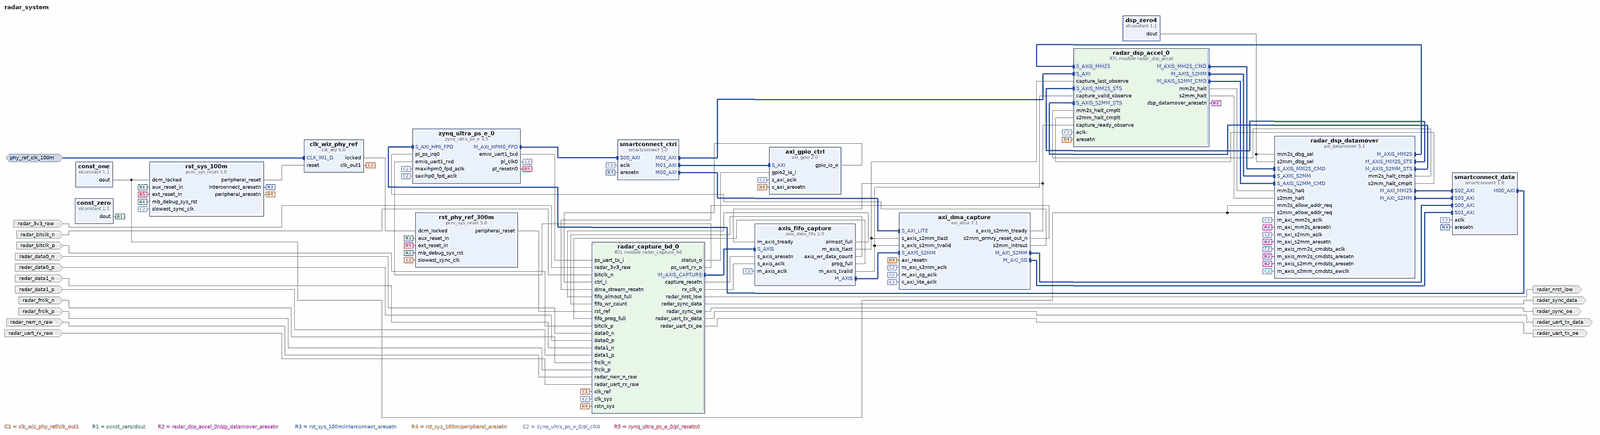
[diagram p0: block diagram of the top level, whole]
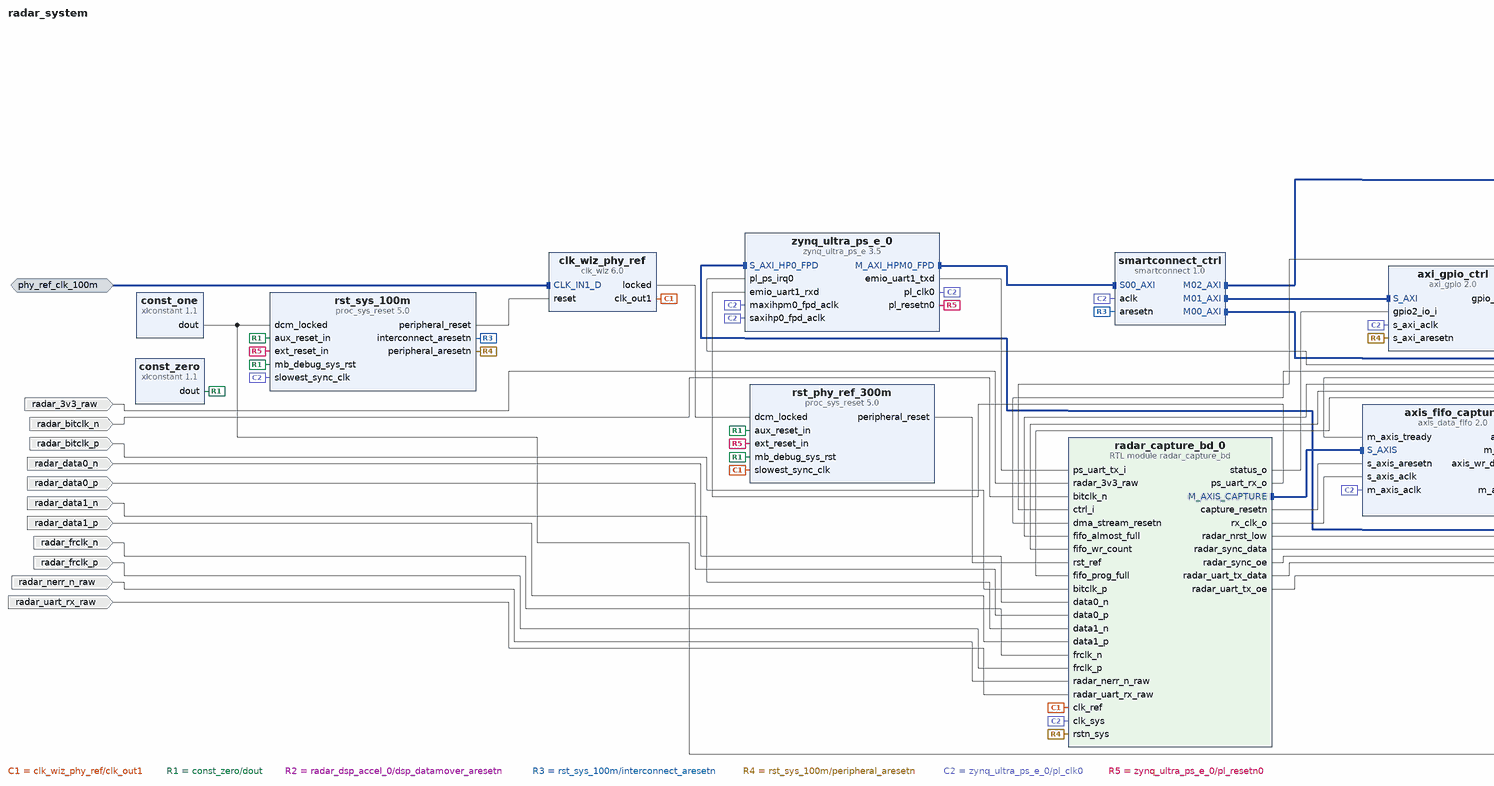
[diagram p1: block diagram of the top level, left part]
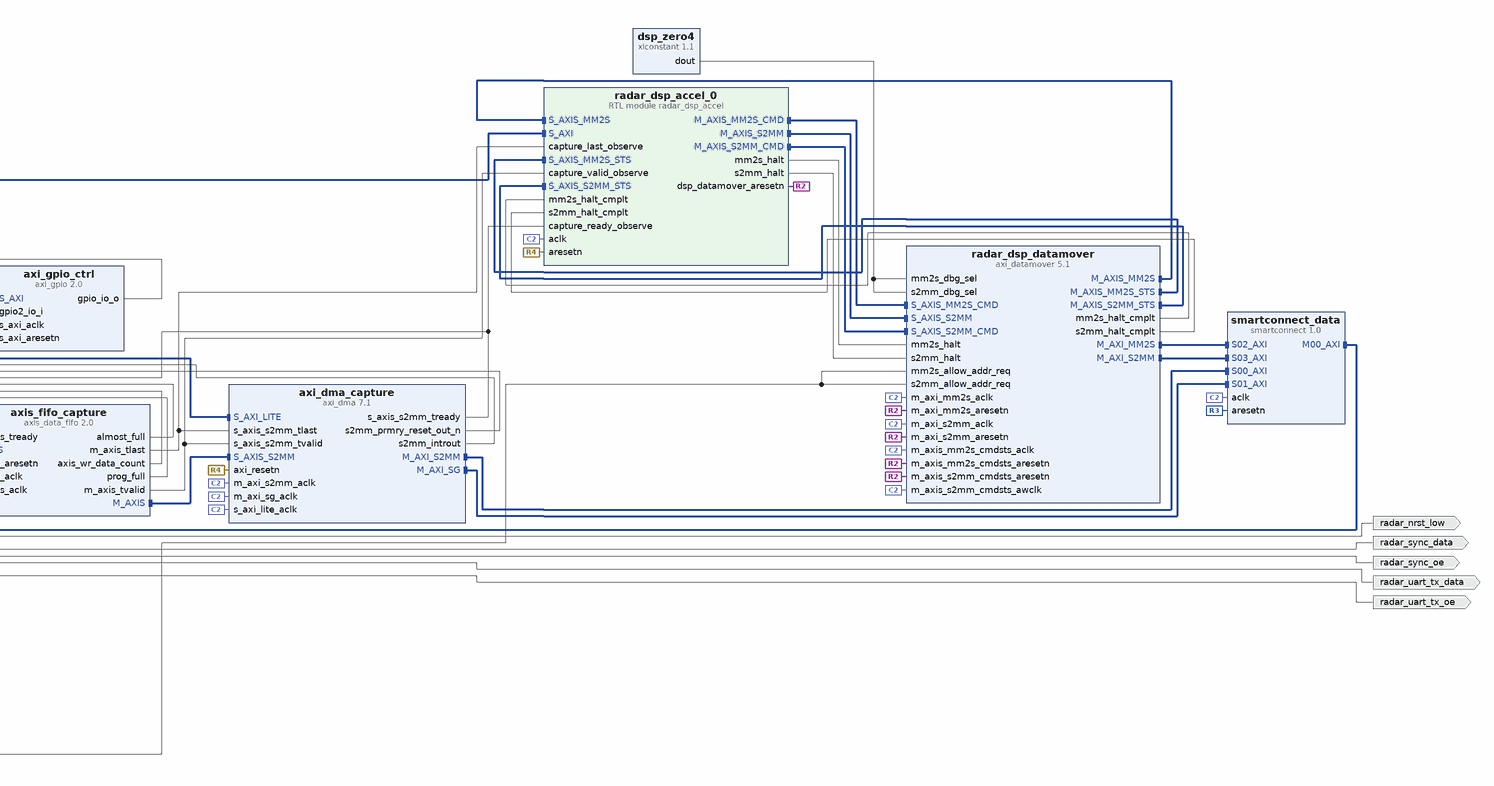
[diagram p2: block diagram of the top level, right part]
# Vivado block design radar_system, xczu2cg-sfvc784-1-e, Vivado 2025.1
create_bd_design radar_system

create_bd_intf_port -mode Slave -vlnv xilinx.com:interface:diff_clock_rtl:1.0 phy_ref_clk_100m
set_property -dict {CONFIG.FREQ_HZ 100000000} [get_bd_intf_ports phy_ref_clk_100m]
create_bd_port -dir I radar_bitclk_p
create_bd_port -dir I radar_bitclk_n
create_bd_port -dir I radar_frclk_p
create_bd_port -dir I radar_frclk_n
create_bd_port -dir I radar_data0_p
create_bd_port -dir I radar_data0_n
create_bd_port -dir I radar_data1_p
create_bd_port -dir I radar_data1_n
create_bd_port -dir I radar_uart_rx_raw
create_bd_port -dir I radar_3v3_raw
create_bd_port -dir I radar_nerr_n_raw
create_bd_port -dir O radar_uart_tx_data
create_bd_port -dir O radar_uart_tx_oe
create_bd_port -dir O radar_nrst_low
create_bd_port -dir O radar_sync_data
create_bd_port -dir O radar_sync_oe

create_bd_cell -type ip -vlnv xilinx.com:ip:smartconnect:1.0 smartconnect_ctrl
set_property -dict {CONFIG.NUM_MI 3 CONFIG.NUM_SI 1} [get_bd_cells smartconnect_ctrl]
create_bd_cell -type ip -vlnv xilinx.com:ip:axi_gpio:2.0 axi_gpio_ctrl
set_property -dict {CONFIG.C_ALL_INPUTS_2 1 CONFIG.C_ALL_OUTPUTS 1 CONFIG.C_IS_DUAL 1} [get_bd_cells axi_gpio_ctrl]
create_bd_cell -type ip -vlnv xilinx.com:ip:proc_sys_reset:5.0 rst_sys_100m
set_property -dict {CONFIG.C_AUX_RESET_HIGH 1} [get_bd_cells rst_sys_100m]
create_bd_cell -type ip -vlnv xilinx.com:ip:axi_dma:7.1 axi_dma_capture
set_property -dict [list \
  CONFIG.c_include_mm2s 0 \
  CONFIG.c_include_sg 1 \
  CONFIG.c_m_axi_s2mm_data_width 64 \
  CONFIG.c_s2mm_burst_size 64 \
  CONFIG.c_s_axis_s2mm_tdata_width 64 \
  CONFIG.c_sg_length_width 23 \
] [get_bd_cells axi_dma_capture]
create_bd_cell -type ip -vlnv xilinx.com:ip:axis_data_fifo:2.0 axis_fifo_capture
set_property -dict [list \
  CONFIG.FIFO_DEPTH 8192 \
  CONFIG.FIFO_MEMORY_TYPE block \
  CONFIG.HAS_AFULL 1 \
  CONFIG.HAS_PROG_FULL 1 \
  CONFIG.HAS_TKEEP 1 \
  CONFIG.HAS_TLAST 1 \
  CONFIG.HAS_TSTRB 0 \
  CONFIG.HAS_WR_DATA_COUNT 1 \
  CONFIG.IS_ACLK_ASYNC 1 \
  CONFIG.PROG_FULL_THRESH 7168 \
  CONFIG.TDATA_NUM_BYTES 8 \
] [get_bd_cells axis_fifo_capture]
create_bd_cell -type ip -vlnv xilinx.com:ip:smartconnect:1.0 smartconnect_data
set_property -dict {CONFIG.NUM_SI 4} [get_bd_cells smartconnect_data]
create_bd_cell -type ip -vlnv xilinx.com:ip:zynq_ultra_ps_e:3.5 zynq_ultra_ps_e_0
set_property -dict [list \
  CONFIG.PSU_BANK_0_IO_STANDARD LVCMOS18 \
  CONFIG.PSU_BANK_1_IO_STANDARD LVCMOS18 \
  CONFIG.PSU_BANK_2_IO_STANDARD LVCMOS18 \
  CONFIG.PSU_BANK_3_IO_STANDARD LVCMOS18 \
  CONFIG.PSU__CRF_APB__DDR_CTRL__FREQMHZ 1200 \
  CONFIG.PSU__CRF_APB__DDR_CTRL__SRCSEL DPLL \
  CONFIG.PSU__CRF_APB__DP_AUDIO_REF_CTRL__SRCSEL DPLL \
  CONFIG.PSU__CRF_APB__DP_STC_REF_CTRL__SRCSEL VPLL \
  CONFIG.PSU__CRF_APB__DP_VIDEO_REF_CTRL__FREQMHZ 148.5 \
  CONFIG.PSU__CRF_APB__DP_VIDEO_REF_CTRL__SRCSEL VPLL \
  CONFIG.PSU__CRF_APB__TOPSW_MAIN_CTRL__FREQMHZ 400 \
  CONFIG.PSU__CRF_APB__TOPSW_MAIN_CTRL__SRCSEL DPLL \
  CONFIG.PSU__CRF_APB__VPLL_FRAC_CFG__ENABLED 1 \
  CONFIG.PSU__CRL_APB__QSPI_REF_CTRL__FREQMHZ 200 \
  CONFIG.PSU__DDRC__BUS_WIDTH {64 Bit} \
  CONFIG.PSU__DDRC__COMPONENTS Components \
  CONFIG.PSU__DDRC__DEVICE_CAPACITY {4096 MBits} \
  CONFIG.PSU__DDRC__DRAM_WIDTH {16 Bits} \
  CONFIG.PSU__DDRC__ECC Disabled \
  CONFIG.PSU__DDRC__MEMORY_TYPE {DDR 4} \
  CONFIG.PSU__DDRC__SPEED_BIN DDR4_2400P \
  CONFIG.PSU__DDR_HIGH_ADDRESS_GUI_ENABLE 0 \
  CONFIG.PSU__DDR__INTERFACE__FREQMHZ 600.000 \
  CONFIG.PSU__DISPLAYPORT__LANE0__ENABLE 1 \
  CONFIG.PSU__DISPLAYPORT__LANE0__IO {GT Lane3} \
  CONFIG.PSU__DISPLAYPORT__LANE1__ENABLE 1 \
  CONFIG.PSU__DISPLAYPORT__LANE1__IO {GT Lane2} \
  CONFIG.PSU__DISPLAYPORT__PERIPHERAL__ENABLE 1 \
  CONFIG.PSU__DPAUX__PERIPHERAL__ENABLE 1 \
  CONFIG.PSU__DPAUX__PERIPHERAL__IO {MIO 27 .. 30} \
  CONFIG.PSU__DP__LANE_SEL {Dual Higher} \
  CONFIG.PSU__DP__REF_CLK_FREQ 27 \
  CONFIG.PSU__DP__REF_CLK_SEL {Ref Clk2} \
  CONFIG.PSU__GT__LINK_SPEED HBR \
  CONFIG.PSU__GT__PRE_EMPH_LVL_4 0 \
  CONFIG.PSU__GT__VLT_SWNG_LVL_4 0 \
  CONFIG.PSU__MAXIGP0__DATA_WIDTH 64 \
  CONFIG.PSU__PSS_REF_CLK__FREQMHZ 33.333 \
  CONFIG.PSU__QSPI_COHERENCY 0 \
  CONFIG.PSU__QSPI_ROUTE_THROUGH_FPD 0 \
  CONFIG.PSU__QSPI__GRP_FBCLK__ENABLE 0 \
  CONFIG.PSU__QSPI__PERIPHERAL__DATA_MODE x4 \
  CONFIG.PSU__QSPI__PERIPHERAL__ENABLE 1 \
  CONFIG.PSU__QSPI__PERIPHERAL__IO {MIO 0 .. 5} \
  CONFIG.PSU__QSPI__PERIPHERAL__MODE Single \
  CONFIG.PSU__SAXIGP2__DATA_WIDTH 64 \
  CONFIG.PSU__UART0__BAUD_RATE 115200 \
  CONFIG.PSU__UART0__MODEM__ENABLE 0 \
  CONFIG.PSU__UART0__PERIPHERAL__ENABLE 1 \
  CONFIG.PSU__UART0__PERIPHERAL__IO {MIO 34 .. 35} \
  CONFIG.PSU__UART1__BAUD_RATE 115200 \
  CONFIG.PSU__UART1__MODEM__ENABLE 0 \
  CONFIG.PSU__UART1__PERIPHERAL__ENABLE 1 \
  CONFIG.PSU__UART1__PERIPHERAL__IO EMIO \
  CONFIG.PSU__USE__IRQ0 1 \
  CONFIG.PSU__USE__M_AXI_GP0 1 \
  CONFIG.PSU__USE__M_AXI_GP2 0 \
  CONFIG.PSU__USE__S_AXI_GP2 1 \
  CONFIG.SUBPRESET1 DDR4_MICRON_MT40A256M16GE_083E \
] [get_bd_cells zynq_ultra_ps_e_0]
# 70 more settings of zynq_ultra_ps_e_0 are not shown: defaults, MIO pin electricals, DDR timing, and values the tool derives
create_bd_cell -type ip -vlnv xilinx.com:ip:xlconstant:1.1 const_zero
set_property -dict {CONFIG.CONST_VAL 0 CONFIG.CONST_WIDTH 1} [get_bd_cells const_zero]
create_bd_cell -type ip -vlnv xilinx.com:ip:xlconstant:1.1 const_one
set_property -dict {CONFIG.CONST_VAL 1 CONFIG.CONST_WIDTH 1} [get_bd_cells const_one]
create_bd_cell -type ip -vlnv xilinx.com:ip:clk_wiz:6.0 clk_wiz_phy_ref
set_property -dict [list \
  CONFIG.CLKOUT1_REQUESTED_OUT_FREQ 300.000 \
  CONFIG.PRIM_SOURCE Differential_clock_capable_pin \
] [get_bd_cells clk_wiz_phy_ref]
create_bd_cell -type ip -vlnv xilinx.com:ip:proc_sys_reset:5.0 rst_phy_ref_300m
set_property -dict {CONFIG.C_AUX_RESET_HIGH 1} [get_bd_cells rst_phy_ref_300m]
create_bd_cell -type module -reference radar_capture_bd radar_capture_bd_0
create_bd_cell -type module -reference radar_dsp_accel radar_dsp_accel_0
create_bd_cell -type ip -vlnv xilinx.com:ip:axi_datamover:5.1 radar_dsp_datamover
set_property -dict [list \
  CONFIG.c_addr_width 32 \
  CONFIG.c_dummy 1 \
  CONFIG.c_enable_mm2s 1 \
  CONFIG.c_enable_mm2s_adv_sig 1 \
  CONFIG.c_enable_s2mm 1 \
  CONFIG.c_enable_s2mm_adv_sig 1 \
  CONFIG.c_include_mm2s_dre false \
  CONFIG.c_include_s2mm_dre false \
  CONFIG.c_m_axi_mm2s_data_width 64 \
  CONFIG.c_m_axi_s2mm_data_width 64 \
  CONFIG.c_m_axis_mm2s_tdata_width 64 \
  CONFIG.c_mm2s_btt_used 23 \
  CONFIG.c_mm2s_burst_size 64 \
  CONFIG.c_s2mm_btt_used 23 \
  CONFIG.c_s2mm_burst_size 64 \
  CONFIG.c_s_axis_s2mm_tdata_width 64 \
] [get_bd_cells radar_dsp_datamover]
create_bd_cell -type ip -vlnv xilinx.com:ip:xlconstant:1.1 dsp_zero4
set_property -dict {CONFIG.CONST_VAL 0 CONFIG.CONST_WIDTH 4} [get_bd_cells dsp_zero4]

# ---- connections ----

connect_bd_intf_net [get_bd_intf_pins axi_dma_capture/M_AXI_S2MM] [get_bd_intf_pins smartconnect_data/S00_AXI]
connect_bd_intf_net [get_bd_intf_pins axi_dma_capture/M_AXI_SG] [get_bd_intf_pins smartconnect_data/S01_AXI]
connect_bd_intf_net [get_bd_intf_pins axis_fifo_capture/M_AXIS] [get_bd_intf_pins axi_dma_capture/S_AXIS_S2MM]
connect_bd_intf_net [get_bd_intf_ports phy_ref_clk_100m] [get_bd_intf_pins clk_wiz_phy_ref/CLK_IN1_D]
connect_bd_intf_net [get_bd_intf_pins radar_capture_bd_0/M_AXIS_CAPTURE] [get_bd_intf_pins axis_fifo_capture/S_AXIS]
connect_bd_intf_net [get_bd_intf_pins radar_dsp_accel_0/M_AXIS_MM2S_CMD] [get_bd_intf_pins radar_dsp_datamover/S_AXIS_MM2S_CMD]
connect_bd_intf_net [get_bd_intf_pins radar_dsp_accel_0/M_AXIS_S2MM] [get_bd_intf_pins radar_dsp_datamover/S_AXIS_S2MM]
connect_bd_intf_net [get_bd_intf_pins radar_dsp_accel_0/M_AXIS_S2MM_CMD] [get_bd_intf_pins radar_dsp_datamover/S_AXIS_S2MM_CMD]
connect_bd_intf_net [get_bd_intf_pins radar_dsp_accel_0/S_AXIS_MM2S] [get_bd_intf_pins radar_dsp_datamover/M_AXIS_MM2S]
connect_bd_intf_net [get_bd_intf_pins radar_dsp_accel_0/S_AXIS_MM2S_STS] [get_bd_intf_pins radar_dsp_datamover/M_AXIS_MM2S_STS]
connect_bd_intf_net [get_bd_intf_pins radar_dsp_accel_0/S_AXIS_S2MM_STS] [get_bd_intf_pins radar_dsp_datamover/M_AXIS_S2MM_STS]
connect_bd_intf_net [get_bd_intf_pins radar_dsp_datamover/M_AXI_MM2S] [get_bd_intf_pins smartconnect_data/S02_AXI]
connect_bd_intf_net [get_bd_intf_pins radar_dsp_datamover/M_AXI_S2MM] [get_bd_intf_pins smartconnect_data/S03_AXI]
connect_bd_intf_net [get_bd_intf_pins smartconnect_ctrl/M00_AXI] [get_bd_intf_pins axi_dma_capture/S_AXI_LITE]
connect_bd_intf_net [get_bd_intf_pins smartconnect_ctrl/M01_AXI] [get_bd_intf_pins axi_gpio_ctrl/S_AXI]
connect_bd_intf_net [get_bd_intf_pins smartconnect_ctrl/M02_AXI] [get_bd_intf_pins radar_dsp_accel_0/S_AXI]
connect_bd_intf_net [get_bd_intf_pins smartconnect_data/M00_AXI] [get_bd_intf_pins zynq_ultra_ps_e_0/S_AXI_HP0_FPD]
connect_bd_intf_net [get_bd_intf_pins zynq_ultra_ps_e_0/M_AXI_HPM0_FPD] [get_bd_intf_pins smartconnect_ctrl/S00_AXI]
connect_bd_net [get_bd_pins axi_dma_capture/s_axis_s2mm_tready] \
  [get_bd_pins axis_fifo_capture/m_axis_tready] [get_bd_pins radar_dsp_accel_0/capture_ready_observe]
connect_bd_net [get_bd_pins axi_dma_capture/s2mm_introut] [get_bd_pins zynq_ultra_ps_e_0/pl_ps_irq0]
connect_bd_net [get_bd_pins axi_dma_capture/s2mm_prmry_reset_out_n] [get_bd_pins radar_capture_bd_0/dma_stream_resetn]
connect_bd_net [get_bd_pins axi_gpio_ctrl/gpio_io_o] [get_bd_pins radar_capture_bd_0/ctrl_i]
connect_bd_net [get_bd_pins axis_fifo_capture/almost_full] [get_bd_pins radar_capture_bd_0/fifo_almost_full]
connect_bd_net [get_bd_pins axis_fifo_capture/axis_wr_data_count] [get_bd_pins radar_capture_bd_0/fifo_wr_count]
connect_bd_net [get_bd_pins axis_fifo_capture/m_axis_tlast] \
  [get_bd_pins axi_dma_capture/s_axis_s2mm_tlast] [get_bd_pins radar_dsp_accel_0/capture_last_observe]
connect_bd_net [get_bd_pins axis_fifo_capture/m_axis_tvalid] \
  [get_bd_pins axi_dma_capture/s_axis_s2mm_tvalid] [get_bd_pins radar_dsp_accel_0/capture_valid_observe]
connect_bd_net [get_bd_pins axis_fifo_capture/prog_full] [get_bd_pins radar_capture_bd_0/fifo_prog_full]
connect_bd_net [get_bd_pins clk_wiz_phy_ref/clk_out1] [get_bd_pins rst_phy_ref_300m/slowest_sync_clk] [get_bd_pins radar_capture_bd_0/clk_ref]
connect_bd_net [get_bd_pins clk_wiz_phy_ref/locked] [get_bd_pins rst_phy_ref_300m/dcm_locked]
connect_bd_net [get_bd_pins const_one/dout] \
  [get_bd_pins rst_sys_100m/dcm_locked] [get_bd_pins radar_dsp_datamover/mm2s_allow_addr_req] \
  [get_bd_pins radar_dsp_datamover/s2mm_allow_addr_req]
connect_bd_net [get_bd_pins const_zero/dout] \
  [get_bd_pins rst_sys_100m/aux_reset_in] [get_bd_pins rst_sys_100m/mb_debug_sys_rst] \
  [get_bd_pins rst_phy_ref_300m/aux_reset_in] [get_bd_pins rst_phy_ref_300m/mb_debug_sys_rst]
connect_bd_net [get_bd_pins dsp_zero4/dout] [get_bd_pins radar_dsp_datamover/mm2s_dbg_sel] [get_bd_pins radar_dsp_datamover/s2mm_dbg_sel]
connect_bd_net [get_bd_ports radar_3v3_raw] [get_bd_pins radar_capture_bd_0/radar_3v3_raw]
connect_bd_net [get_bd_ports radar_bitclk_n] [get_bd_pins radar_capture_bd_0/bitclk_n]
connect_bd_net [get_bd_ports radar_bitclk_p] [get_bd_pins radar_capture_bd_0/bitclk_p]
connect_bd_net [get_bd_pins radar_capture_bd_0/capture_resetn] [get_bd_pins axis_fifo_capture/s_axis_aresetn]
connect_bd_net [get_bd_pins radar_capture_bd_0/ps_uart_rx_o] [get_bd_pins zynq_ultra_ps_e_0/emio_uart1_rxd]
connect_bd_net [get_bd_pins radar_capture_bd_0/radar_nrst_low] [get_bd_ports radar_nrst_low]
connect_bd_net [get_bd_pins radar_capture_bd_0/radar_sync_data] [get_bd_ports radar_sync_data]
connect_bd_net [get_bd_pins radar_capture_bd_0/radar_sync_oe] [get_bd_ports radar_sync_oe]
connect_bd_net [get_bd_pins radar_capture_bd_0/radar_uart_tx_data] [get_bd_ports radar_uart_tx_data]
connect_bd_net [get_bd_pins radar_capture_bd_0/radar_uart_tx_oe] [get_bd_ports radar_uart_tx_oe]
connect_bd_net [get_bd_pins radar_capture_bd_0/rx_clk_o] [get_bd_pins axis_fifo_capture/s_axis_aclk]
connect_bd_net [get_bd_pins radar_capture_bd_0/status_o] [get_bd_pins axi_gpio_ctrl/gpio2_io_i]
connect_bd_net [get_bd_ports radar_data0_n] [get_bd_pins radar_capture_bd_0/data0_n]
connect_bd_net [get_bd_ports radar_data0_p] [get_bd_pins radar_capture_bd_0/data0_p]
connect_bd_net [get_bd_ports radar_data1_n] [get_bd_pins radar_capture_bd_0/data1_n]
connect_bd_net [get_bd_ports radar_data1_p] [get_bd_pins radar_capture_bd_0/data1_p]
connect_bd_net [get_bd_pins radar_dsp_accel_0/dsp_datamover_aresetn] \
  [get_bd_pins radar_dsp_datamover/m_axi_mm2s_aresetn] [get_bd_pins radar_dsp_datamover/m_axis_mm2s_cmdsts_aresetn] \
  [get_bd_pins radar_dsp_datamover/m_axi_s2mm_aresetn] [get_bd_pins radar_dsp_datamover/m_axis_s2mm_cmdsts_aresetn]
connect_bd_net [get_bd_pins radar_dsp_accel_0/mm2s_halt] [get_bd_pins radar_dsp_datamover/mm2s_halt]
connect_bd_net [get_bd_pins radar_dsp_accel_0/s2mm_halt] [get_bd_pins radar_dsp_datamover/s2mm_halt]
connect_bd_net [get_bd_pins radar_dsp_datamover/mm2s_halt_cmplt] [get_bd_pins radar_dsp_accel_0/mm2s_halt_cmplt]
connect_bd_net [get_bd_pins radar_dsp_datamover/s2mm_halt_cmplt] [get_bd_pins radar_dsp_accel_0/s2mm_halt_cmplt]
connect_bd_net [get_bd_ports radar_frclk_n] [get_bd_pins radar_capture_bd_0/frclk_n]
connect_bd_net [get_bd_ports radar_frclk_p] [get_bd_pins radar_capture_bd_0/frclk_p]
connect_bd_net [get_bd_ports radar_nerr_n_raw] [get_bd_pins radar_capture_bd_0/radar_nerr_n_raw]
connect_bd_net [get_bd_ports radar_uart_rx_raw] [get_bd_pins radar_capture_bd_0/radar_uart_rx_raw]
connect_bd_net [get_bd_pins rst_phy_ref_300m/peripheral_reset] [get_bd_pins radar_capture_bd_0/rst_ref]
connect_bd_net [get_bd_pins rst_sys_100m/interconnect_aresetn] [get_bd_pins smartconnect_ctrl/aresetn] [get_bd_pins smartconnect_data/aresetn]
connect_bd_net [get_bd_pins rst_sys_100m/peripheral_aresetn] \
  [get_bd_pins axi_dma_capture/axi_resetn] [get_bd_pins axi_gpio_ctrl/s_axi_aresetn] \
  [get_bd_pins radar_capture_bd_0/rstn_sys] [get_bd_pins radar_dsp_accel_0/aresetn]
connect_bd_net [get_bd_pins rst_sys_100m/peripheral_reset] [get_bd_pins clk_wiz_phy_ref/reset]
connect_bd_net [get_bd_pins zynq_ultra_ps_e_0/emio_uart1_txd] [get_bd_pins radar_capture_bd_0/ps_uart_tx_i]
connect_bd_net [get_bd_pins zynq_ultra_ps_e_0/pl_clk0] \
  [get_bd_pins zynq_ultra_ps_e_0/maxihpm0_fpd_aclk] [get_bd_pins zynq_ultra_ps_e_0/saxihp0_fpd_aclk] \
  [get_bd_pins smartconnect_ctrl/aclk] [get_bd_pins smartconnect_data/aclk] [get_bd_pins axi_dma_capture/s_axi_lite_aclk] \
  [get_bd_pins axi_dma_capture/m_axi_s2mm_aclk] [get_bd_pins axi_gpio_ctrl/s_axi_aclk] \
  [get_bd_pins rst_sys_100m/slowest_sync_clk] [get_bd_pins axi_dma_capture/m_axi_sg_aclk] \
  [get_bd_pins axis_fifo_capture/m_axis_aclk] [get_bd_pins radar_capture_bd_0/clk_sys] \
  [get_bd_pins radar_dsp_datamover/m_axi_mm2s_aclk] [get_bd_pins radar_dsp_datamover/m_axis_mm2s_cmdsts_aclk] \
  [get_bd_pins radar_dsp_datamover/m_axi_s2mm_aclk] [get_bd_pins radar_dsp_datamover/m_axis_s2mm_cmdsts_awclk] \
  [get_bd_pins radar_dsp_accel_0/aclk]
connect_bd_net [get_bd_pins zynq_ultra_ps_e_0/pl_resetn0] [get_bd_pins rst_sys_100m/ext_reset_in] [get_bd_pins rst_phy_ref_300m/ext_reset_in]

# ---- address map ----
assign_bd_address -offset 0x00000000 -range 2G -target_address_space [get_bd_addr_spaces axi_dma_capture/Data_S2MM] [get_bd_addr_segs zynq_ultra_ps_e_0/SAXIGP2/HP0_DDR_LOW]
assign_bd_address -offset 0x00000000 -range 2G -target_address_space [get_bd_addr_spaces axi_dma_capture/Data_SG] [get_bd_addr_segs zynq_ultra_ps_e_0/SAXIGP2/HP0_DDR_LOW]
assign_bd_address -offset 0x00000000 -range 2G -target_address_space [get_bd_addr_spaces radar_dsp_datamover/Data_MM2S] [get_bd_addr_segs zynq_ultra_ps_e_0/SAXIGP2/HP0_DDR_LOW]
assign_bd_address -offset 0x00000000 -range 2G -target_address_space [get_bd_addr_spaces radar_dsp_datamover/Data_S2MM] [get_bd_addr_segs zynq_ultra_ps_e_0/SAXIGP2/HP0_DDR_LOW]
assign_bd_address -offset 0x00A0000000 -range 64K -target_address_space [get_bd_addr_spaces zynq_ultra_ps_e_0/Data] [get_bd_addr_segs axi_dma_capture/S_AXI_LITE/Reg]
assign_bd_address -offset 0x00A0010000 -range 64K -target_address_space [get_bd_addr_spaces zynq_ultra_ps_e_0/Data] [get_bd_addr_segs axi_gpio_ctrl/S_AXI/Reg]
assign_bd_address -offset 0x00A0020000 -range 64K -target_address_space [get_bd_addr_spaces zynq_ultra_ps_e_0/Data] [get_bd_addr_segs radar_dsp_accel_0/S_AXI/reg0]

validate_bd_design
save_bd_design
